# Altium project ESP32-S31-CoreBoard-1.PrjPcb
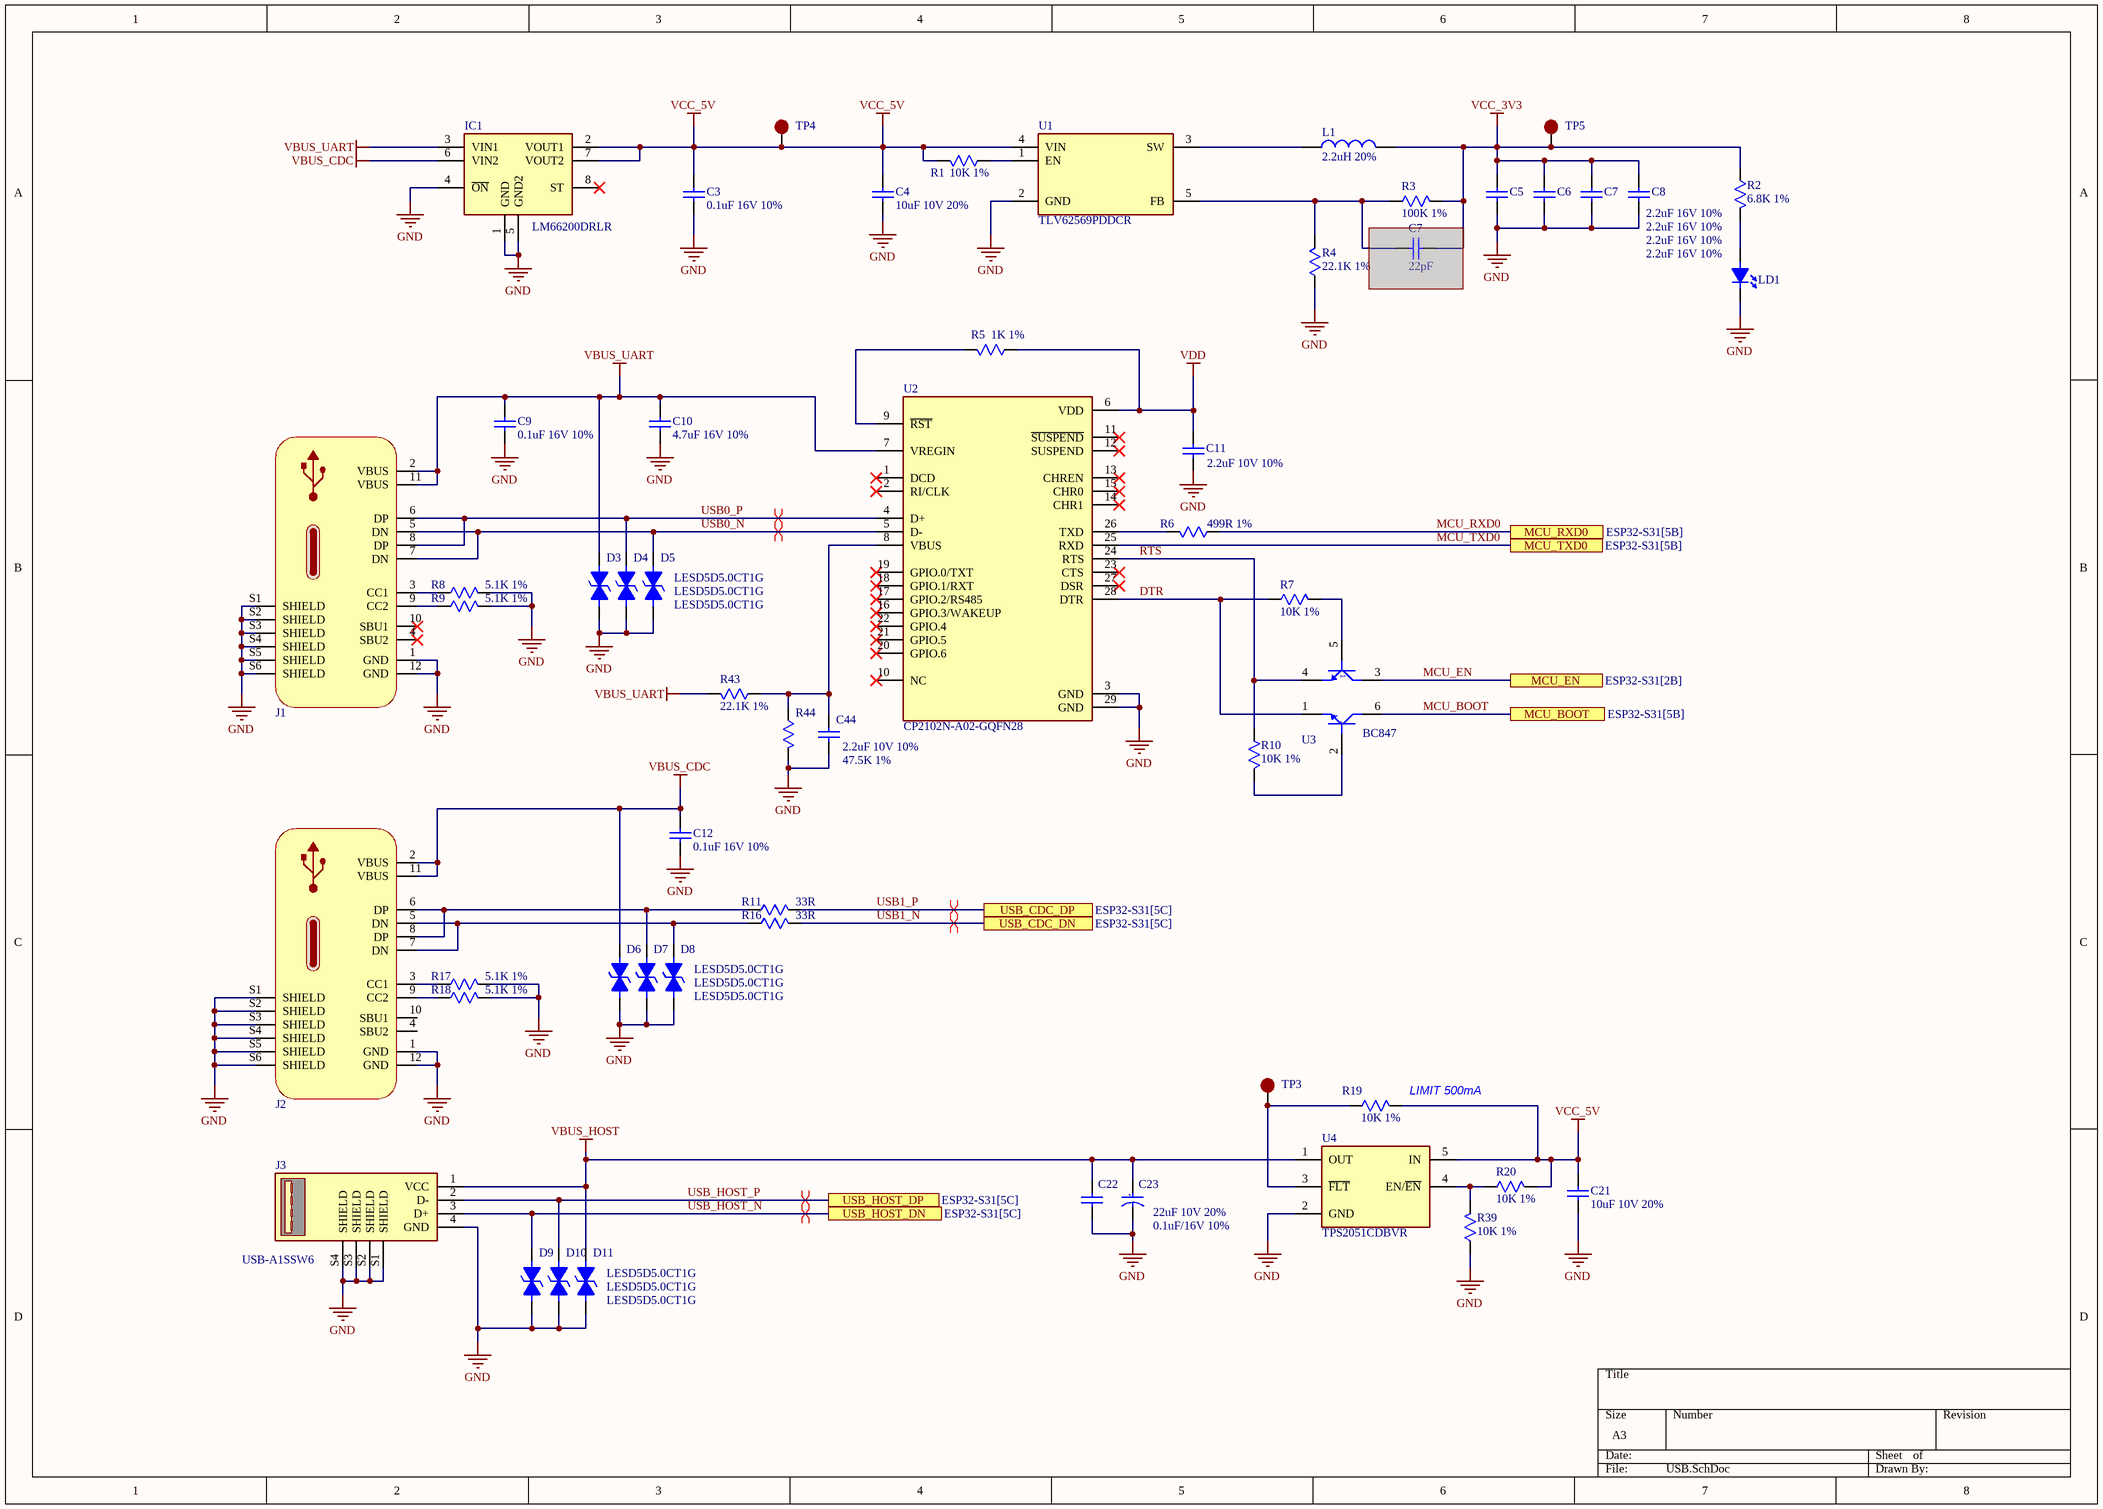
[diagram p0: USB.SchDoc]
4 sheets, 158 parts. Net scope: flat (ports and power ports of the same name join across sheets).
Board file: ESP32-S31-CoreBoard-1.PcbDoc
Sheets:
  USB.SchDoc
  ESP32-S31.SchDoc
  Audio.SchDoc
  Ethernet.SchDoc

## Sheet USB.SchDoc
size A3; SheetNumber: 1; SheetTotal: 4

### Parts
(Parts that share a designator on the sheet are numbered #1, #2 ... from top to bottom, then left to right.)
C3  0.1uF 16V 10%  [C0402]
C4  10uF 10V 20%  [C0805]
C5  2.2uF 16V 10%  [C0603]
C6  2.2uF 16V 10%  [C0603]
C7#1  2.2uF 16V 10%  [C0603]
C7#2  22pF  [C0402]  (masked out: inside a compile mask, not in the netlist)
C8  2.2uF 16V 10%  [C0603]
C9  0.1uF 16V 10%  [C0402]
C10  4.7uF 16V 10%  [C0603]
C11  2.2uF 10V 10%  [C0402]
C12  0.1uF 16V 10%  [C0603]
C21  10uF 10V 20%  [C0603]
C22  0.1uF/16V 10%  [C0402]
C23  22uF 10V 20%  [C1206P]
C44  2.2uF 10V 10%  [C0402]
D3  LESD5D5.0CT1G  [SOD-523]
D4  LESD5D5.0CT1G  [SOD-523]
D5  LESD5D5.0CT1G  [SOD-523]
D6  LESD5D5.0CT1G  [SOD-523]
D7  LESD5D5.0CT1G  [SOD-523]
D8  LESD5D5.0CT1G  [SOD-523]
D9  LESD5D5.0CT1G  [SOD-523]
D10  LESD5D5.0CT1G  [SOD-523]
D11  LESD5D5.0CT1G  [SOD-523]
IC1  LM66200DRLR  [SOT8]
J1  USB-C  [JAE_DX07S016JA1R1500]  (value not drawn)
J2  USB-C  [JAE_DX07S016JA1R1500]  (value not drawn)
J3  USB-A1SSW6  [USB-A-Vertical]
L1  2.2uH 20%  [IND_ASPI-0530HI-2R2M-T2]
LD1  LED-SMD  [LED0603]  (value not drawn)
R1  10K 1%  [R0402]
R2  6.8K 1%  [R0402]
R3  100K 1%  [R0402]
R4  22.1K 1%  [R0402]
R5  1K 1%  [R0402]
R6  499R 1%  [R0402]
R7  10K 1%  [R0402]
R8  5.1K 1%  [R0402]
R9  5.1K 1%  [R0402]
R10  10K 1%  [R0402]
R11  33R  [R0402]
R16  33R  [R0402]
R17  5.1K 1%  [R0402]
R18  5.1K 1%  [R0402]
R19  10K 1%  [R0402]
R20  10K 1%  [R0402]
R39#1  10K 1%  [R0402]
R43#1  22.1K 1%  [R0402]
R44#1  47.5K 1%  [R0402]
TP3  Test point  [TP]  (value not drawn)
TP4  Test point  [TP]  (value not drawn)
TP5  Test point  [TP]  (value not drawn)
U1  TLV62569PDDCR  [SOT23-5]
U2  CP2102N-A02-GQFN28  [QFN-28]
U3  BC847  [SOT-363]
U4  TPS2051CDBVR  [SOT23-5]

### Ports
MCU_BOOT (see ESP32-S31[5B]), MCU_EN (see ESP32-S31[2B]), MCU_RXD0 (see ESP32-S31[5B]), MCU_TXD0 (see ESP32-S31[5B]), USB_CDC_DN (see ESP32-S31[5C]), USB_CDC_DP (see ESP32-S31[5C]), USB_HOST_DN (see ESP32-S31[5C]), USB_HOST_DP (see ESP32-S31[5C])

### Nets
GND: C3.1 C4.1 C5.2 C6.2 C7#1.2 C8.2 C9.1 C10.1 C11.1 C12.1 C21.1 C22.1 C23.2 C44.1 D3.2(K) D4.2(K) D5.2(K) D6.2(K) D7.2(K) D8.2(K) D9.2(K) D10.2(K) D11.2(K) IC1.1(GND) IC1.4(~{ON}) IC1.5(GND2) J1.1(GND) J1.12(GND) J1.S1(SHIELD) J1.S2(SHIELD) J1.S3(SHIELD) J1.S4(SHIELD) J1.S5(SHIELD) J1.S6(SHIELD) J2.1(GND) J2.12(GND) J2.S1(SHIELD) J2.S2(SHIELD) J2.S3(SHIELD) J2.S4(SHIELD) J2.S5(SHIELD) J2.S6(SHIELD) J3.4(GND) J3.S1(SHIELD) J3.S2(SHIELD) J3.S3(SHIELD) J3.S4(SHIELD) LD1.2 R4.1 R8.2 R9.2 R17.2 R18.2 R39#1.1 R44#1.2 U1.2(GND) U2.3(GND) U2.29(GND) U4.2(GND)
VBUS_CDC: C12.2 D6.1(A) IC1.6(VIN2) J2.2(VBUS) J2.11(VBUS)
VBUS_HOST: C22.2 C23.1 D11.1(A) J3.1(VCC) U4.1(OUT)
VBUS_UART: C9.2 C10.2 D3.1(A) IC1.3(VIN1) J1.2(VBUS) J1.11(VBUS) R43#1.2 U2.7(VREGIN)
VCC_3V3: C5.1 C6.1 C7#1.1 C8.1 L1.2 R2.1 R3.2 TP5.1(EPAD)
VCC_5V: C3.2 C4.2 C21.2 IC1.2(VOUT1) IC1.7(VOUT2) R1.2 R19.2 R20.2 TP4.1(EPAD) U1.4(VIN) U4.5(IN)
VDD: C11.2 R5.1 U2.6(VDD)
DTR: R7.1 U2.28(DTR) U3.1
MCU_BOOT: U3.6 ; port MCU_BOOT
MCU_EN: U3.3 ; port MCU_EN
MCU_RXD0: R6.1 ; port MCU_RXD0
MCU_TXD0: U2.25(RXD) ; port MCU_TXD0
RTS: R10.1 U2.24(RTS) U3.4
USB0_N: D5.1(A) J1.5(DN) J1.7(DN) U2.5(D-)
USB0_P: D4.1(A) J1.6(DP) J1.8(DP) U2.4(D+)
USB1_N: R16.2 ; port USB_CDC_DN
USB1_P: R11.2 ; port USB_CDC_DP
USB_HOST_N: D9.1(A) J3.3(D+) ; port USB_HOST_DN
USB_HOST_P: D10.1(A) J3.2(D-) ; port USB_HOST_DP
NetC44_2: C44.2 R43#1.1 R44#1.1 U2.8(VBUS)
NetD7_1: D7.1(A) J2.6(DP) J2.8(DP) R11.1
NetD8_1: D8.1(A) J2.5(DN) J2.7(DN) R16.1
NetJ1_3: J1.3(CC1) R8.1
NetJ1_9: J1.9(CC2) R9.1
NetJ2_3: J2.3(CC1) R17.1
NetJ2_9: J2.9(CC2) R18.1
NetL1_1: L1.1 U1.3(SW)
NetLD1_1: LD1.1 R2.2
NetR1_1: R1.1 U1.1(EN)
NetR3_1: R3.1 R4.2 U1.5(FB)
NetR5_2: R5.2 U2.9(~{RST})
NetR6_2: R6.2 U2.26(TXD)
NetR7_2: R7.2 U3.5
NetR10_2: R10.2 U3.2
NetR19_1: R19.1 TP3.1(EPAD) U4.3(~{FLT})
NetR20_1: R20.1 R39#1.2 U4.4(EN/~{EN})

Not connected (* = marked no-connect by the designer): IC1 8(ST)*; J1 4(SBU2)* 10(SBU1)*; J2 4(SBU2) 10(SBU1); U2 1(DCD)* 2(RI/CLK)* 10(NC)* 11(~{SUSPEND})* 12(SUSPEND)* 13(CHREN)* 14(CHR1)* 15(CHR0)* 16(GPIO.3/WAKEUP)* 17(GPIO.2/RS485)* 18(GPIO.1/RXT)* 19(GPIO.0/TXT)* 20(GPIO.6)* 21(GPIO.5)* 22(GPIO.4)* 23(CTS)* 27(DSR)*

### Layout directives
differential pair: USB0_N, USB0_P, USB1_N, USB1_P, USB_HOST_N, USB_HOST_P

### Notes on the sheet
- (near R19) LIMIT 500mA
- (in symbol Capacitor_Tantalum) +

### Library data of the parts
C3-C6 C7#1 C7#2 C8-C12 C21 C22 C44 = Capacitor_Ceramic
C23 = Capacitor_Tantalum: MF: KYOCERA AVX; MP: TAJA106K016RNJ; SnapEDA_Link: https://www.snapeda.com/parts/TAJA106K016RNJ/Kyocera/view-part/?ref=snap; Package: Package; Value: *; Check_prices: https://www.snapeda.com/parts/TAJA106K016RNJ/Kyocera/view-part/?ref=eda
D3-D11 = Diode_ESD
IC1 = LM66200DRLR: 1.6-V to 5.5-V, 40-mâ„¦, 2.5-A, low-IQ, dual ideal diode; MF: Texas Instruments; SnapEDA_Link: https://www.snapeda.com/parts/LM66200DRLR/Texas+Instruments/view-part/?ref=snap; Package: None; Value: *; MP: LM66200DRLR; Check_prices: https://www.snapeda.com/parts/LM66200DRLR/Texas+Instruments/view-part/?ref=eda
J1 J2 = USB-C: USB-C (USB TYPE-C) USB 2.0 Receptacle Connector 24 (16+8 Dummy) Position Surface Mount, Right Angle; Through Hole; MP: DX07S016JA1R1500; Package: None; Value: *; Price: None; Availability: Unavailable
J3 = USB-A1SSW6: USB-A (USB TYPE-A) - Receptacle Connector 4 Position Through Hole, Right Angle; MF: On Shore; Value: *; SnapEDA_Link: https://www.snapeda.com/parts/USB-A1SSW6/On+Shore+Technology+Inc./view-part/?ref=snap; Purchase-URL: https://pricing.snapeda.com/search/part/USB-A1SSW6/?ref=eda; Availability: In Stock; Price: None; Package: None; Check_prices: https://www.snapeda.com/parts/USB-A1SSW6/On+Shore+Technology+Inc./view-part/?ref=eda; MP: USB-A1SSW6
L1 = Inductor
R1-R11 R16-R20 R39#1 R43#1 R44#1 = Resistor
U1 = TLV62569PDDCR: 2.5V-5.5V input, 2-A high efficiency step-down buck converter in SOT23 and SOT563 package; MF: Texas Instruments; SnapEDA_Link: https://www.snapeda.com/parts/TLV62569PDDCR/Texas+Instruments/view-part/?ref=snap; Package: SOT-23-THN-6 Texas Instruments; Value: *; MP: TLV62569PDDCR; Check_prices: https://www.snapeda.com/parts/TLV62569PDDCR/Texas+Instruments/view-part/?ref=eda
U2 = CP2102N-A02-GQFN28: USB TO UART BRIDGE, -40 TO 85DEG C; Bridge Type:USB to UART; Supply Voltage Min:3V; Supply Voltage Max:3.6V; Interface Case Style:QFN; No. of Pins:28Pins; Operating Temperature Min:-40Â°C; Operating Temperature Max:85Â°C; Product Range:-; Automotive Quali; MF: Silicon Labs; MP: CP2102NA02GQFN28; SnapEDA_Link: https://www.snapeda.com/parts/CP2102NA02GQFN28/Silicon+Labs/view-part/?ref=snap; Package: None; Value: *; Check_prices: https://www.snapeda.com/parts/CP2102NA02GQFN28/Silicon+Labs/view-part/?ref=eda
U3 = BC847: Bipolar (BJT) Transistor Array 2 NPN (Dual) 45V 100mA 100MHz 380mW Surface Mount SC-88/SC70-6/SOT-363; MF: onsemi; MP: BC847BDW1T1G; SnapEDA_Link: https://www.snapeda.com/parts/BC847BDW1T1G/Onsemi/view-part/?ref=snap; Package: SC-88-6 ON Semiconductor; Value: *; Check_prices: https://www.snapeda.com/parts/BC847BDW1T1G/Onsemi/view-part/?ref=eda
U4 = TPS2051CDBVR: 0.5A loading, 4.5-5.5V, 97mÎ© USB power switch, active-high, output discharge, reverse blocking; MF: Texas Instruments; SnapEDA_Link: https://www.snapeda.com/parts/TPS2051CDBVR/Texas+Instruments/view-part/?ref=snap; Package: SOT-23-5 Texas Instruments; Value: *; MP: TPS2051CDBVR; Check_prices: https://www.snapeda.com/parts/TPS2051CDBVR/Texas+Instruments/view-part/?ref=eda

## Sheet ESP32-S31.SchDoc
size A3; SheetNumber: 2; SheetTotal: 4
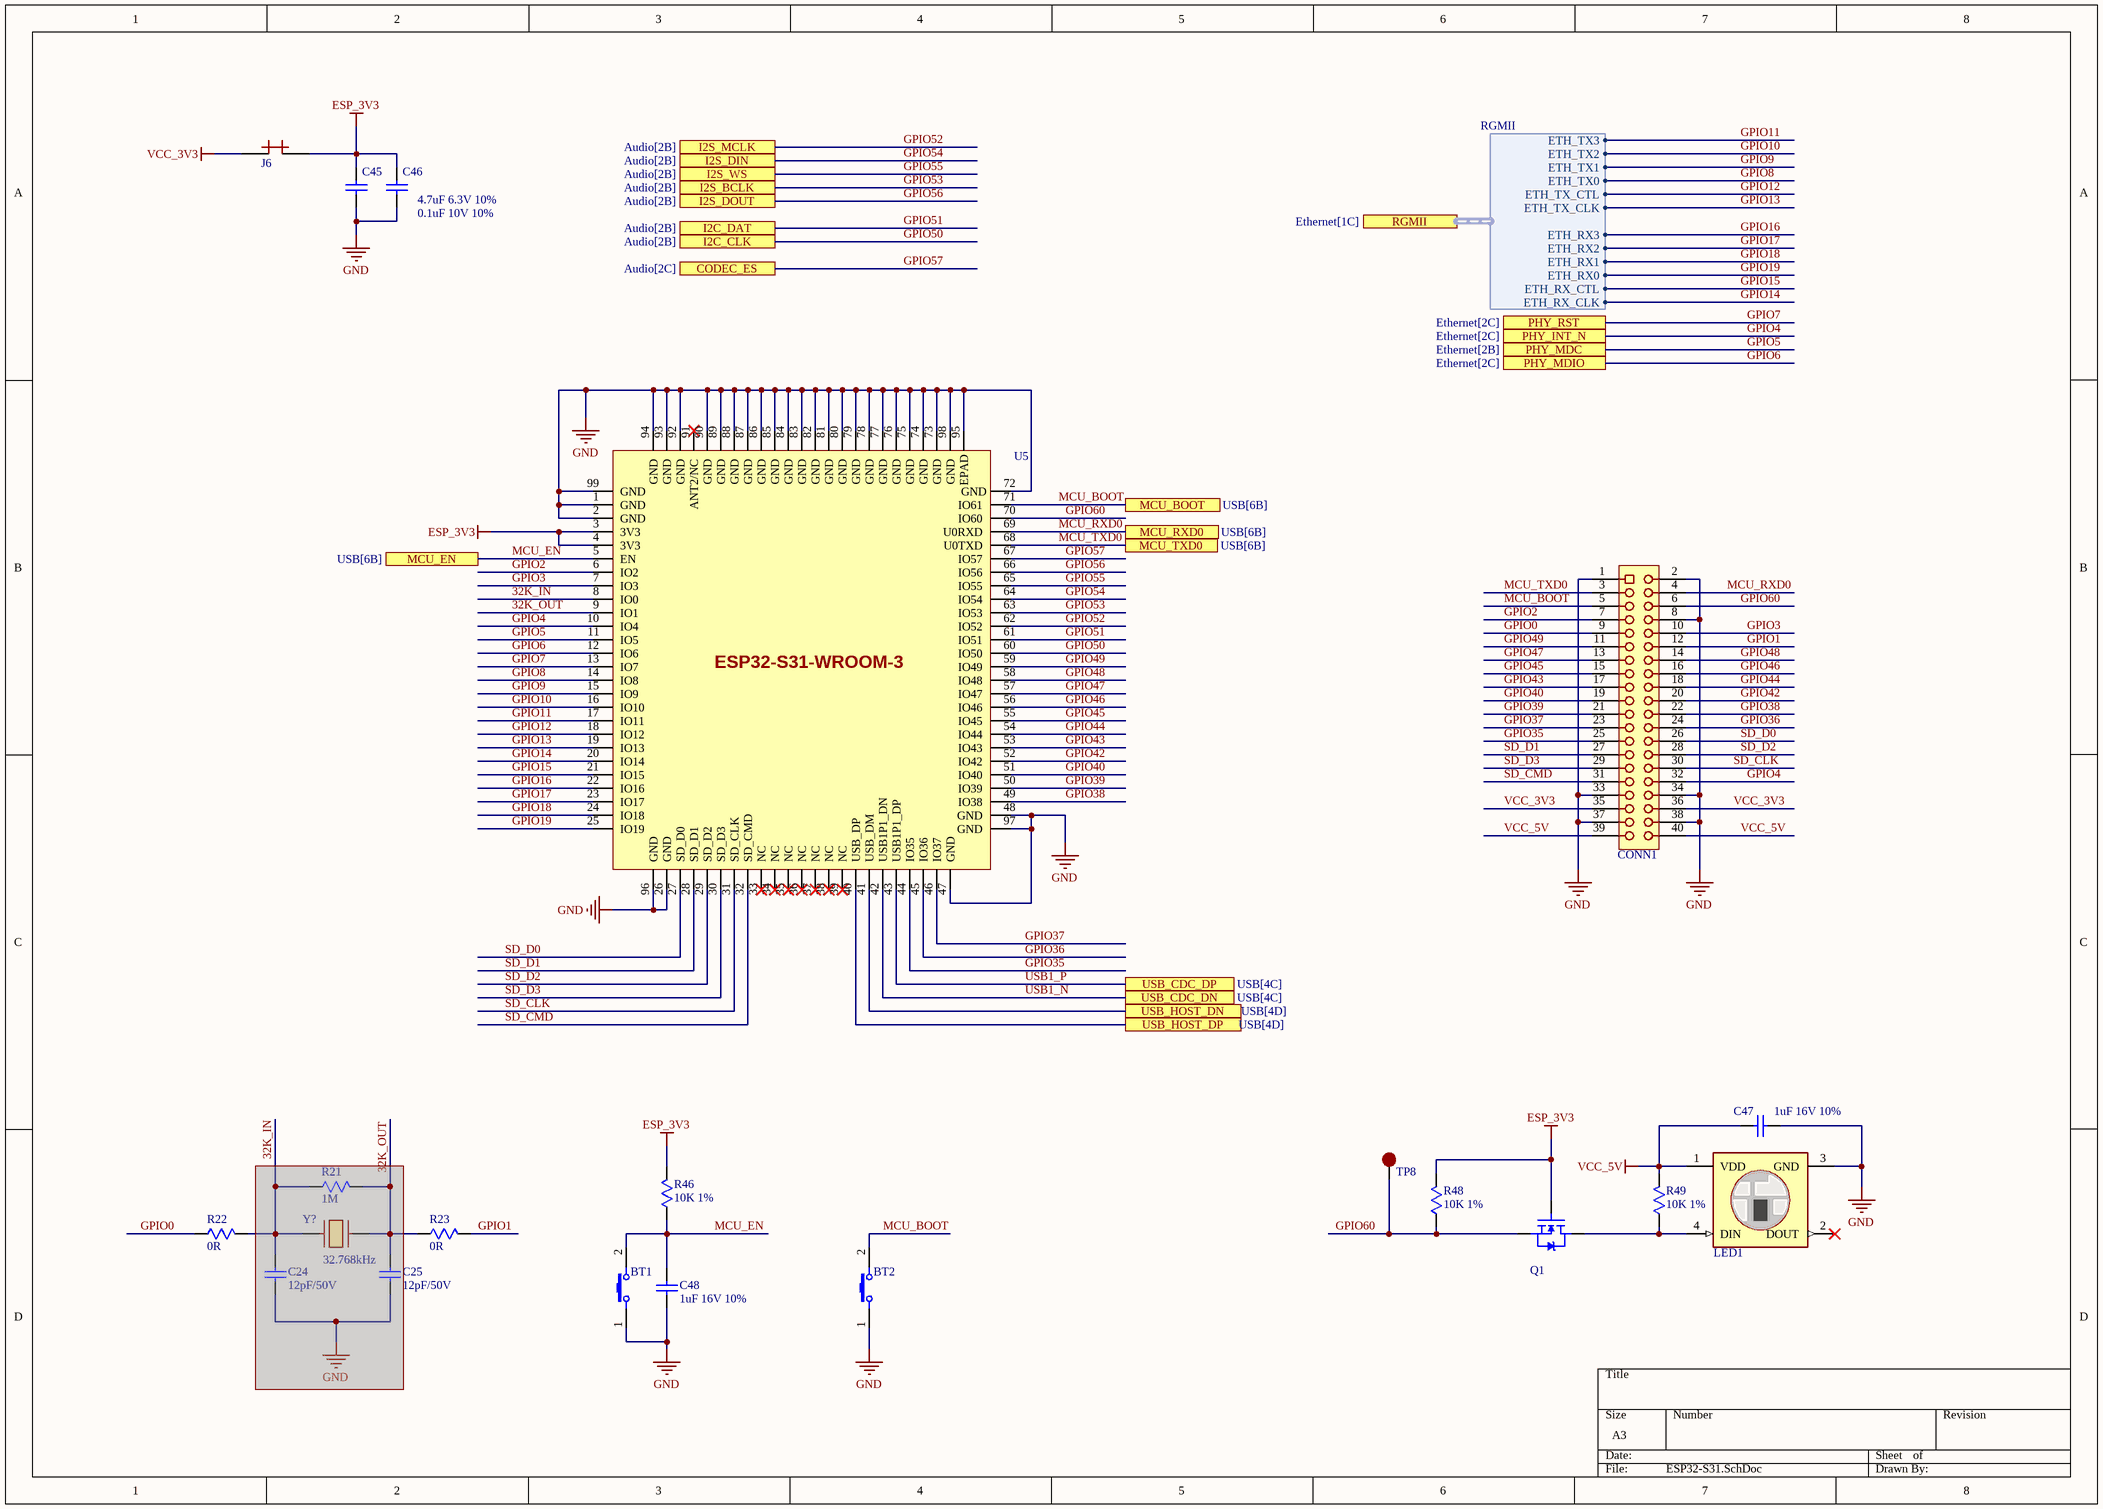
[diagram p1: ESP32-S31.SchDoc]

### Parts
(Parts that share a designator on the sheet are numbered #1, #2 ... from top to bottom, then left to right.)
BT1  Button-2  [SW_B3U-1000PM]  (value not drawn)
BT2  Button-2  [SW_B3U-1000PM]  (value not drawn)
C24#1  12pF/50V  [C0402]  (masked out: inside a compile mask, not in the netlist)
C25#1  12pF/50V  [C0402]  (masked out: inside a compile mask, not in the netlist)
C45  4.7uF 6.3V 10%  [C0603]
C46  0.1uF 10V 10%  [C0402]
C47  1uF 16V 10%  [C0603]
C48  1uF 16V 10%  [C0402]
CONN1  CONNECTOR-2X20  [2.54 2x20]  (value not drawn)
J6  Jump_2.54mm  [2.54 2X1]  (value not drawn)
LED1  ARGB  [WS2812-5050]  (value not drawn)
Q1  Mosfet N Signal  [SOT-23]  (value not drawn)
R21#1  1M  [R0402]  (masked out: inside a compile mask, not in the netlist)
R22  0R  [R0402]
R23  0R  [R0402]
R46#1  10K 1%  [R0402]
R48  10K 1%  [R0402]
R49  10K 1%  [R0402]
TP8  Test point  [TP]  (value not drawn)
U5  ESP32-S31-WROOM-3  [ESP32-S31-WROOM-3]  (value not drawn)
Y?  32.768kHz  [XTAL 2P 3215]  (masked out: inside a compile mask, not in the netlist)

### Ports
CODEC_ES (see Audio[2C]), I2C_CLK (see Audio[2B]), I2C_DAT (see Audio[2B]), I2S_BCLK (see Audio[2B]), I2S_DIN (see Audio[2B]), I2S_DOUT (see Audio[2B]), I2S_MCLK (see Audio[2B]), I2S_WS (see Audio[2B]), MCU_BOOT (see USB[6B]), MCU_EN (see USB[6B]), MCU_RXD0 (see USB[6B]), MCU_TXD0 (see USB[6B]), PHY_INT_N (see Ethernet[2C]), PHY_MDC (see Ethernet[2B]), PHY_MDIO (see Ethernet[2C]), PHY_RST (see Ethernet[2C]), RGMII (harness RGMII, see Ethernet[1C]), USB_CDC_DN (see USB[4C]), USB_CDC_DP (see USB[4C]), USB_HOST_DN (see USB[4D]), USB_HOST_DP (see USB[4D])

### Harnesses
RGMII: ETH_TX1, ETH_TX0, ETH_TX_CTL, ETH_TX_CLK, ETH_RX0, ETH_RX_CTL, ETH_RX_CLK, ETH_TX2, ETH_TX3, ETH_RX1, ETH_RX2, ETH_RX3

### Nets
ESP_3V3: C45.2 C46.2 J6.2 Q1.1(G) R46#1.1 R48.1 U5.3(3V3) U5.4(3V3)
GND: BT1.1 BT2.1 C45.1 C46.1 C47.1 C48.2 CONN1.1 CONN1.2 CONN1.8 CONN1.33 CONN1.34 CONN1.37 CONN1.38 LED1.3(GND) U5.1(GND) U5.2(GND) U5.26(GND) U5.47(GND) U5.48(GND) U5.72(GND) U5.73(GND) U5.74(GND) U5.75(GND) U5.76(GND) U5.77(GND) U5.78(GND) U5.79(GND) U5.80(GND) U5.81(GND) U5.82(GND) U5.83(GND) U5.84(GND) U5.85(GND) U5.86(GND) U5.87(GND) U5.88(GND) U5.89(GND) U5.90(GND) U5.92(GND) U5.93(GND) U5.94(GND) U5.95(EPAD) U5.96(GND) U5.97(GND) U5.98(GND) U5.99(GND)
VCC_3V3: CONN1.35 CONN1.36 J6.1
VCC_5V: C47.2 CONN1.39 CONN1.40 LED1.1(VDD) R49.1
32K_IN: U5.8(IO0)
32K_OUT: U5.9(IO1)
GPIO0: CONN1.9 R22.1
GPIO1: CONN1.12 R23.1
GPIO2: CONN1.7 U5.6(IO2)
GPIO3: CONN1.10 U5.7(IO3)
GPIO4: CONN1.32 U5.10(IO4) ; port PHY_INT_N
GPIO5: U5.11(IO5) ; port PHY_MDC
GPIO6: U5.12(IO6) ; port PHY_MDIO
GPIO7: U5.13(IO7) ; port PHY_RST
GPIO8: U5.14(IO8) ; port RGMII.ETH_TX0
GPIO9: U5.15(IO9) ; port RGMII.ETH_TX1
GPIO10: U5.16(IO10) ; port RGMII.ETH_TX2
GPIO11: U5.17(IO11) ; port RGMII.ETH_TX3
GPIO12: U5.18(IO12) ; port RGMII.ETH_TX_CTL
GPIO13: U5.19(IO13) ; port RGMII.ETH_TX_CLK
GPIO14: U5.20(IO14) ; port RGMII.ETH_RX_CLK
GPIO15: U5.21(IO15) ; port RGMII.ETH_RX_CTL
GPIO16: U5.22(IO16) ; port RGMII.ETH_RX3
GPIO17: U5.23(IO17) ; port RGMII.ETH_RX2
GPIO18: U5.24(IO18) ; port RGMII.ETH_RX1
GPIO19: U5.25(IO19) ; port RGMII.ETH_RX0
GPIO35: CONN1.25 U5.44(IO35)
GPIO36: CONN1.24 U5.45(IO36)
GPIO37: CONN1.23 U5.46(IO37)
GPIO38: CONN1.22 U5.49(IO38)
GPIO39: CONN1.21 U5.50(IO39)
GPIO40: CONN1.19 U5.51(IO40)
GPIO42: CONN1.20 U5.52(IO42)
GPIO43: CONN1.17 U5.53(IO43)
GPIO44: CONN1.18 U5.54(IO44)
GPIO45: CONN1.15 U5.55(IO45)
GPIO46: CONN1.16 U5.56(IO46)
GPIO47: CONN1.13 U5.57(IO47)
GPIO48: CONN1.14 U5.58(IO48)
GPIO49: CONN1.11 U5.59(IO49)
GPIO50: U5.60(IO50) ; port I2C_CLK
GPIO51: U5.61(IO51) ; port I2C_DAT
GPIO52: U5.62(IO52) ; port I2S_MCLK
GPIO53: U5.63(IO53) ; port I2S_BCLK
GPIO54: U5.64(IO54) ; port I2S_DIN
GPIO55: U5.65(IO55) ; port I2S_WS
GPIO56: U5.66(IO56) ; port I2S_DOUT
GPIO57: U5.67(IO57) ; port CODEC_ES
GPIO60: CONN1.6 Q1.2(D) R48.2 TP8.1(EPAD) U5.70(IO60)
MCU_BOOT: BT2.2 CONN1.5 U5.71(IO61) ; port MCU_BOOT
MCU_EN: BT1.2 C48.1 R46#1.2 U5.5(EN) ; port MCU_EN
MCU_RXD0: CONN1.4 U5.69(U0RXD) ; port MCU_RXD0
MCU_TXD0: CONN1.3 U5.68(U0TXD) ; port MCU_TXD0
SD_CLK: CONN1.30 U5.31(SD_CLK)
SD_CMD: CONN1.31 U5.32(SD_CMD)
SD_D0: CONN1.26 U5.27(SD_D0)
SD_D1: CONN1.27 U5.28(SD_D1)
SD_D2: CONN1.28 U5.29(SD_D2)
SD_D3: CONN1.29 U5.30(SD_D3)
USB1_N: U5.42(USB1P1_DN) ; port USB_CDC_DN
USB1_P: U5.43(USB1P1_DP) ; port USB_CDC_DP
USB_HOST_N: U5.41(USB_DM) ; port USB_HOST_DN
USB_HOST_P: U5.40(USB_DP) ; port USB_HOST_DP
NetLED1_4: LED1.4(DIN) Q1.3(S) R49.2

Not connected (* = marked no-connect by the designer): LED1 2(DOUT)*; R22 2; R23 2; U5 33(NC)* 34(NC)* 35(NC)* 36(NC)* 37(NC)* 38(NC)* 39(NC)* 91(ANT2/NC)*

### Library data of the parts
C24#1 C25#1 C45-C48 = Capacitor_Ceramic
LED1 = ARGB: 5050 symphony LED SMD; MF: Xinglight; MP: XL-5050RGBC-WS2812B; SnapEDA_Link: https://www.snapeda.com/parts/XL-5050RGBC-WS2812B/Xinglight/view-part/?ref=snap; Package: Package; Value: *; Check_prices: https://www.snapeda.com/parts/XL-5050RGBC-WS2812B/Xinglight/view-part/?ref=eda
Q1 = 2N7000
R21#1 R22 R23 R46#1 R48 R49 = Resistor
Y? = Crystal 2 Pin: LOW FREQUENCY CRYSTAL; MF: Micro Crystal; MP: CM7V-T1A-LOW-ESR-32.768KHZ-12.5PF-20-TA-QC; Package: SMD-2 Micro Crystal; Value: *; Check_prices: https://www.snapeda.com/parts/CM7V-T1A-LOW-ESR-32.768KHZ-12.5PF-20-TA-QC/Micro+Crystal/view-part/?ref=eda; SnapEDA_Link: https://www.snapeda.com/parts/CM7V-T1A-LOW-ESR-32.768KHZ-12.5PF-20-TA-QC/Micro+Crystal/view-part/?ref=snap; Availability: In Stock; Purchase-URL: https://pricing.snapeda.com/search/part/CM7V-T1A-LOW-ESR-32.768KHZ-12.5PF-20-TA-QC/?ref=eda; Price: None

## Sheet Audio.SchDoc
size A4; SheetNumber: 3; SheetTotal: 4
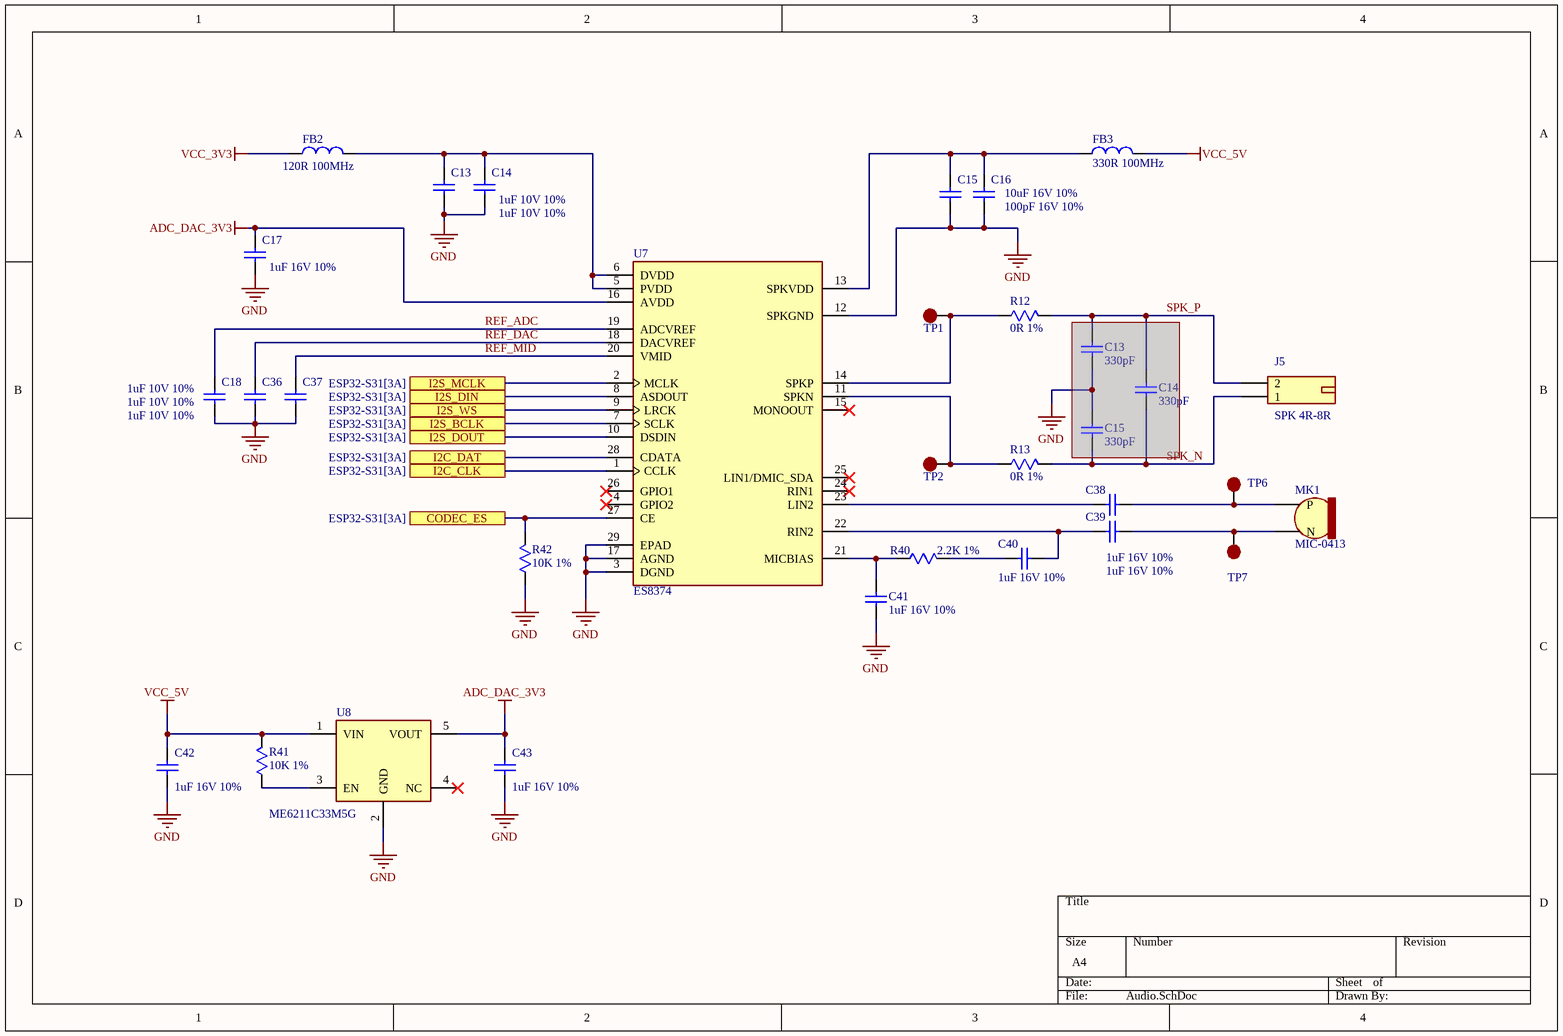
[diagram p2: Audio.SchDoc]

### Parts
(Parts that share a designator on the sheet are numbered #1, #2 ... from top to bottom, then left to right.)
C13#1  1uF 10V 10%  [C0402]
C13#2  330pF  [C0603]  (masked out: inside a compile mask, not in the netlist)
C14#1  1uF 10V 10%  [C0402]
C14#2  330pF  [C0603]  (masked out: inside a compile mask, not in the netlist)
C15#1  100pF 16V 10%  [C0402]
C15#2  330pF  [C0603]  (masked out: inside a compile mask, not in the netlist)
C16  10uF 16V 10%  [C0603]
C17  1uF 16V 10%  [C0402]
C18  1uF 10V 10%  [C0402]
C36  1uF 10V 10%  [C0402]
C37  1uF 10V 10%  [C0402]
C38  1uF 16V 10%  [C0402]
C39  1uF 16V 10%  [C0402]
C40  1uF 16V 10%  [C0402]
C41  1uF 16V 10%  [C0402]
C42  1uF 16V 10%  [C0402]
C43  1uF 16V 10%  [C0402]
FB2  120R 100MHz  [L0603]
FB3  330R 100MHz  [L0603]
J5  SPK 4R-8R  [JST_S2B-PH-SM4-TB(LF)(SN)]
MK1  MIC-0413  [MIC_CMEJ-0413-42-SMT-TR]
R12  0R 1%  [R0603]
R13  0R 1%  [R0603]
R40#1  2.2K 1%  [R0402]
R41#1  10K 1%  [R0402]
R42#1  10K 1%  [R0402]
TP1  Test point  [TP]  (value not drawn)
TP2  Test point  [TP]  (value not drawn)
TP6  Test point  [TP]  (value not drawn)
TP7  Test point  [TP]  (value not drawn)
U7  ES8374  [QFN-28]
U8  ME6211C33M5G  [SOT23-5]

### Ports
CODEC_ES (see ESP32-S31[3A]), I2C_CLK (see ESP32-S31[3A]), I2C_DAT (see ESP32-S31[3A]), I2S_BCLK (see ESP32-S31[3A]), I2S_DIN (see ESP32-S31[3A]), I2S_DOUT (see ESP32-S31[3A]), I2S_MCLK (see ESP32-S31[3A]), I2S_WS (see ESP32-S31[3A])

### Nets
ADC_DAC_3V3: C17.1 C43.1 U7.16(AVDD) U8.5(VOUT)
GND: C13#1.2 C14#1.2 C15#1.2 C16.2 C17.2 C18.2 C36.2 C37.2 C41.2 C42.2 C43.2 R42#1.1 U7.3(DGND) U7.12(SPKGND) U7.17(AGND) U7.29(EPAD) U8.2(GND)
VCC_3V3: FB2.1
VCC_5V: C42.1 FB3.1 R41#1.2 U8.1(VIN)
GPIO50: U7.1(CCLK) ; port I2C_CLK
GPIO51: U7.28(CDATA) ; port I2C_DAT
GPIO52: U7.2(MCLK) ; port I2S_MCLK
GPIO53: U7.7(SCLK) ; port I2S_BCLK
GPIO54: U7.8(ASDOUT) ; port I2S_DIN
GPIO55: U7.9(LRCK) ; port I2S_WS
GPIO56: U7.10(DSDIN) ; port I2S_DOUT
GPIO57: R42#1.2 U7.27(CE) ; port CODEC_ES
REF_ADC: C18.1 U7.19(ADCVREF)
REF_DAC: C36.1 U7.18(DACVREF)
REF_MID: C37.1 U7.20(VMID)
SPK_N: J5.1 R13.2
SPK_P: J5.2 R12.2
NetC13#1_1: C13#1.1 C14#1.1 FB2.2 U7.5(PVDD) U7.6(DVDD)
NetC15#1_1: C15#1.1 C16.1 FB3.2 U7.13(SPKVDD)
NetC38_1: C38.1 MK1.1(P) TP6.1(EPAD)
NetC38_2: C38.2 U7.23(LIN2)
NetC39_1: C39.1 MK1.2(N) TP7.1(EPAD)
NetC39_2: C39.2 C40.1 U7.22(RIN2)
NetC40_2: C40.2 R40#1.2
NetC41_1: C41.1 R40#1.1 U7.21(MICBIAS)
NetR12_1: R12.1 TP1.1(EPAD) U7.14(SPKP)
NetR13_1: R13.1 TP2.1(EPAD) U7.11(SPKN)
NetR41#1_1: R41#1.1 U8.3(EN)

Not connected (* = marked no-connect by the designer): U7 4(GPIO2)* 15(MONOOUT)* 24(RIN1)* 25(LIN1/DMIC_SDA)* 26(GPIO1)*; U8 4(NC)*

### Library data of the parts
C13#1 C13#2 C14#1 C14#2 C15#1 C15#2 C16-C18 C36-C43 = Capacitor_Ceramic
FB2 FB3 = Ferrite-bead
J5 = CONNECTOR-2P
MK1 = MIC-0413: 4.0 mm, Omnidirectional, Surface Mount, 2.0 Vdc, Electret Condenser Microphone; MF: Same Sky; MP: CMEJ-0413-42-SMT-TR; SnapEDA_Link: https://www.snapeda.com/parts/CMEJ-0413-42-SMT-TR/Same+Sky/view-part/?ref=snap; Package: CUI Inc.; Value: *; Check_prices: https://www.snapeda.com/parts/CMEJ-0413-42-SMT-TR/Same+Sky/view-part/?ref=eda
R12 R13 R40#1 R41#1 R42#1 = Resistor
U7 = ES8374: Low Power Mono Audio CODEC. 24-bit, 8 to 96 kHz sampling frequency, 95 dB signal to noise ratio.; MF: Everest Semiconductor; SnapEDA_Link: https://www.snapeda.com/parts/ES8374/Everest+Semiconductor/view-part/?ref=snap; Package: None; Value: *; MP: ES8374; Check_prices: https://www.snapeda.com/parts/ES8374/Everest+Semiconductor/view-part/?ref=eda
U8 = ME6211C33M5G: MF: Microne; SnapEDA_Link: https://www.snapeda.com/parts/ME6211C33M5G/Microne/view-part/?ref=snap; Package: None; Value: *; MP: ME6211C33M5G; Check_prices: https://www.snapeda.com/parts/ME6211C33M5G/Microne/view-part/?ref=eda

## Sheet Ethernet.SchDoc
size A3; SheetNumber: 4; SheetTotal: 4
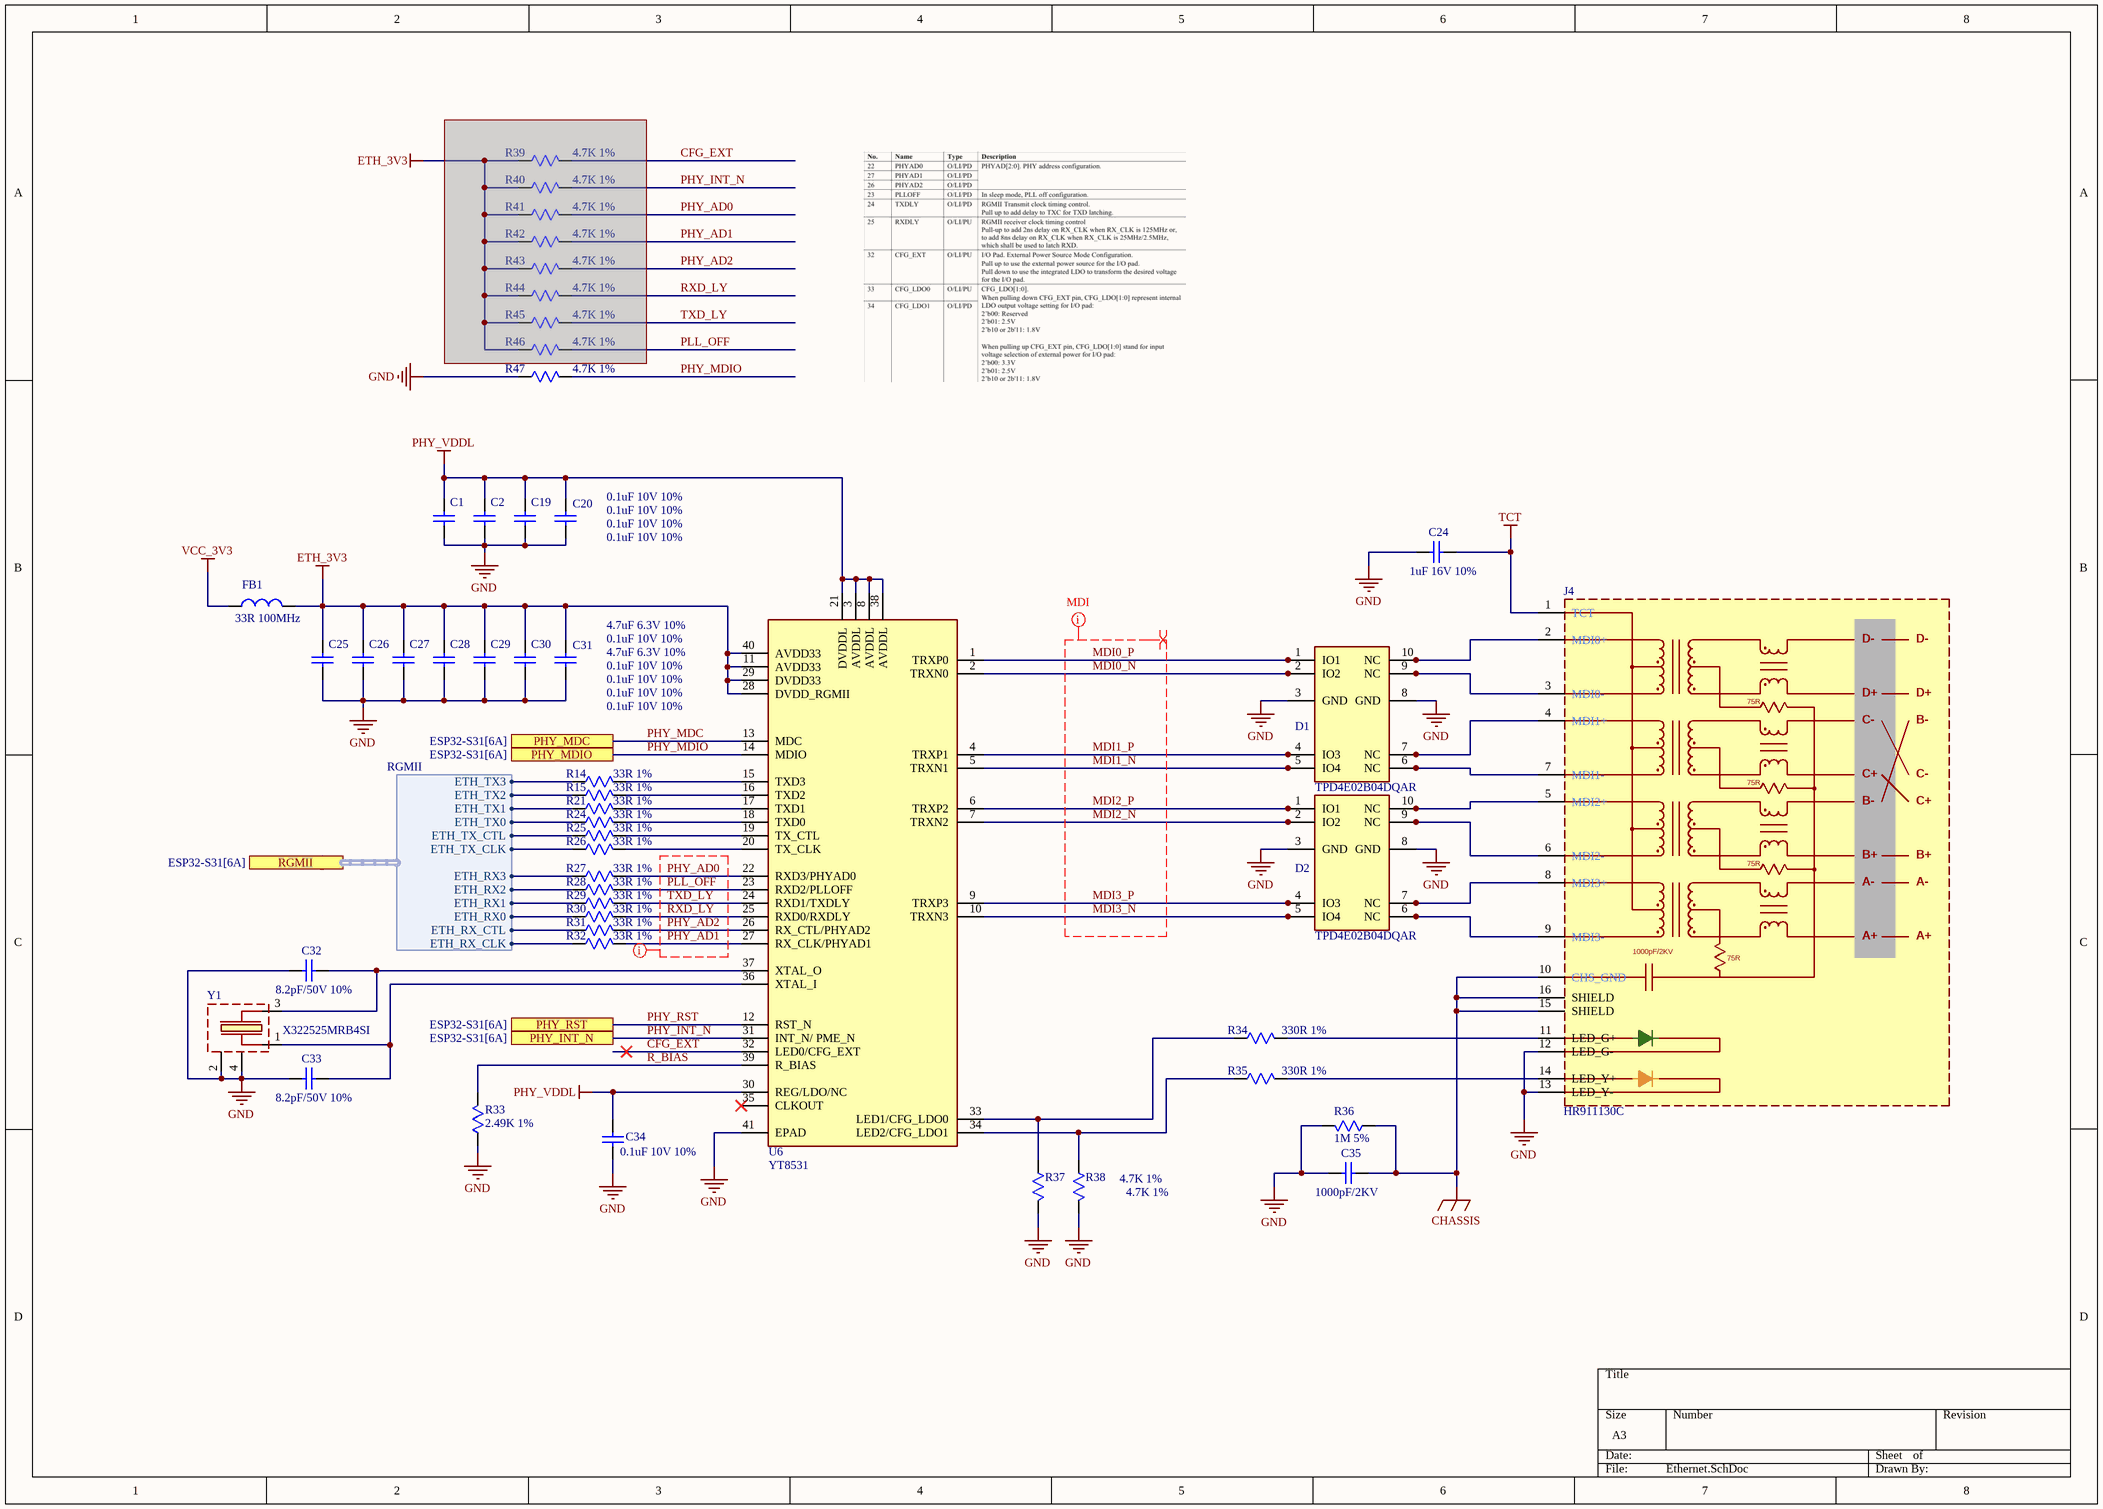
[diagram p3: Ethernet.SchDoc]

### Parts
(Parts that share a designator on the sheet are numbered #1, #2 ... from top to bottom, then left to right.)
C1  0.1uF 10V 10%  [C0402]
C2  0.1uF 10V 10%  [C0402]
C19  0.1uF 10V 10%  [C0402]
C20  0.1uF 10V 10%  [C0402]
C24#2  1uF 16V 10%  [C0603]
C25#2  4.7uF 6.3V 10%  [C0603]
C26  4.7uF 6.3V 10%  [C0603]
C27  0.1uF 10V 10%  [C0402]
C28  0.1uF 10V 10%  [C0402]
C29  0.1uF 10V 10%  [C0402]
C30  0.1uF 10V 10%  [C0402]
C31  0.1uF 10V 10%  [C0402]
C32  8.2pF/50V 10%  [C0402]
C33  8.2pF/50V 10%  [C0402]
C34  0.1uF 10V 10%  [C0402]
C35  1000pF/2KV  [C1206]
D1  TPD4E02B04DQAR  [USON-10]
D2  TPD4E02B04DQAR  [USON-10]
FB1  33R 100MHz  [L0603]
J4  HR911130C  [HR911130C]
R14  33R 1%  [R0402]
R15  33R 1%  [R0402]
R21#2  33R 1%  [R0402]
R24  33R 1%  [R0402]
R25  33R 1%  [R0402]
R26  33R 1%  [R0402]
R27  33R 1%  [R0402]
R28  33R 1%  [R0402]
R29  33R 1%  [R0402]
R30  33R 1%  [R0402]
R31  33R 1%  [R0402]
R32  33R 1%  [R0402]
R33  2.49K 1%  [R0402]
R34  330R 1%  [R0402]
R35  330R 1%  [R0402]
R36  1M 5%  [R1206]
R37  4.7K 1%  [R0402]
R38  4.7K 1%  [R0402]
R39#2  4.7K 1%  [R0402]  (masked out: inside a compile mask, not in the netlist)
R40#2  4.7K 1%  [R0402]  (masked out: inside a compile mask, not in the netlist)
R41#2  4.7K 1%  [R0402]  (masked out: inside a compile mask, not in the netlist)
R42#2  4.7K 1%  [R0402]  (masked out: inside a compile mask, not in the netlist)
R43#2  4.7K 1%  [R0402]  (masked out: inside a compile mask, not in the netlist)
R44#2  4.7K 1%  [R0402]  (masked out: inside a compile mask, not in the netlist)
R45  4.7K 1%  [R0402]  (masked out: inside a compile mask, not in the netlist)
R46#2  4.7K 1%  [R0402]  (masked out: inside a compile mask, not in the netlist)
R47  4.7K 1%  [R0402]
U6  YT8531  [QFN-40]
Y1  X322525MRB4SI  [XTAL 4P 3225]

### Ports
PHY_INT_N (see ESP32-S31[6A]), PHY_MDC (see ESP32-S31[6A]), PHY_MDIO (see ESP32-S31[6A]), PHY_RST (see ESP32-S31[6A]), RGMII (harness RGMII, see ESP32-S31[6A])

### Harnesses
RGMII: ETH_TX1, ETH_TX0, ETH_TX_CTL, ETH_TX_CLK, ETH_RX0, ETH_RX_CTL, ETH_RX_CLK, ETH_TX2, ETH_TX3, ETH_RX1, ETH_RX2, ETH_RX3

### Nets
CHASSIS: C35.2 J4.10(CHS_GND) J4.15(SHIELD) J4.16(SHIELD) R36.1
ETH_3V3: C25#2.2 C26.2 C27.2 C28.2 C29.2 C30.2 C31.2 FB1.2 U6.11(AVDD33) U6.28(DVDD_RGMII) U6.29(DVDD33) U6.40(AVDD33)
GND: C1.1 C2.1 C19.1 C20.1 C24#2.2 C25#2.1 C26.1 C27.1 C28.1 C29.1 C30.1 C31.1 C32.1 C33.1 C34.1 C35.1 D1.3(GND) D1.8(GND) D2.3(GND) D2.8(GND) J4.12(LED_G-) J4.13(LED_Y-) R33.1 R36.2 R37.2 R38.2 R47.1 U6.41(EPAD) Y1.2(GND) Y1.4(GND)
PHY_VDDL: C1.2 C2.2 C19.2 C20.2 C34.2 U6.3(AVDDL) U6.8(AVDDL) U6.21(DVDDL) U6.30(REG/LDO/NC) U6.38(AVDDL)
TCT: C24#2.1 J4.1(TCT)
VCC_3V3: FB1.1
CFG_EXT: U6.32(LED0/CFG_EXT)
GPIO8: R24.1 ; port RGMII.ETH_TX0
GPIO9: R21#2.1 ; port RGMII.ETH_TX1
GPIO10: R15.1 ; port RGMII.ETH_TX2
GPIO11: R14.1 ; port RGMII.ETH_TX3
GPIO12: R25.1 ; port RGMII.ETH_TX_CTL
GPIO13: R26.1 ; port RGMII.ETH_TX_CLK
GPIO14: R32.1 ; port RGMII.ETH_RX_CLK
GPIO15: R31.1 ; port RGMII.ETH_RX_CTL
GPIO16: R27.1 ; port RGMII.ETH_RX3
GPIO17: R28.1 ; port RGMII.ETH_RX2
GPIO18: R29.1 ; port RGMII.ETH_RX1
GPIO19: R30.1 ; port RGMII.ETH_RX0
MDI0_N: D1.2(IO2) D1.9(NC) J4.3(MDI0-) U6.2(TRXN0)
MDI0_P: D1.1(IO1) D1.10(NC) J4.2(MDI0+) U6.1(TRXP0)
MDI1_N: D1.5(IO4) D1.6(NC) J4.7(MDI1-) U6.5(TRXN1)
MDI1_P: D1.4(IO3) D1.7(NC) J4.4(MDI1+) U6.4(TRXP1)
MDI2_N: D2.2(IO2) D2.9(NC) J4.6(MDI2-) U6.7(TRXN2)
MDI2_P: D2.1(IO1) D2.10(NC) J4.5(MDI2+) U6.6(TRXP2)
MDI3_N: D2.5(IO4) D2.6(NC) J4.9(MDI3-) U6.10(TRXN3)
MDI3_P: D2.4(IO3) D2.7(NC) J4.8(MDI3+) U6.9(TRXP3)
PHY_AD0: R27.2 U6.22(RXD3/PHYAD0)
PHY_AD1: R32.2 U6.27(RX_CLK/PHYAD1)
PHY_AD2: R31.2 U6.26(RX_CTL/PHYAD2)
PHY_INT_N: U6.31(INT_N/_PME_N) ; port PHY_INT_N  [project net GPIO4]
PHY_MDC: U6.13(MDC) ; port PHY_MDC  [project net GPIO5]
PHY_MDIO: R47.2 U6.14(MDIO) ; port PHY_MDIO  [project net GPIO6]
PHY_RST: U6.12(RST_N) ; port PHY_RST  [project net GPIO7]
PLL_OFF: R28.2 U6.23(RXD2/PLLOFF)
R_BIAS: R33.2 U6.39(R_BIAS)
RXD_LY: R30.2 U6.25(RXD0/RXDLY)
TXD_LY: R29.2 U6.24(RXD1/TXDLY)
NetC32_2: C32.2 U6.37(XTAL_O) Y1.3
NetC33_2: C33.2 U6.36(XTAL_I) Y1.1
NetJ4_11: J4.11(LED_G+) R34.2
NetJ4_14: J4.14(LED_Y+) R35.2
NetR14_2: R14.2 U6.15(TXD3)
NetR15_2: R15.2 U6.16(TXD2)
NetR21#2_2: R21#2.2 U6.17(TXD1)
NetR24_2: R24.2 U6.18(TXD0)
NetR25_2: R25.2 U6.19(TX_CTL)
NetR26_2: R26.2 U6.20(TX_CLK)
NetR34_1: R34.1 R37.1 U6.33(LED1/CFG_LDO0)
NetR35_1: R35.1 R38.1 U6.34(LED2/CFG_LDO1)

Not connected (* = marked no-connect by the designer): U6 35(CLKOUT)*

### Layout directives
differential pair; differential pair class MDI_class: MDI0_N, MDI0_P, MDI1_N, MDI1_P, MDI2_N, MDI2_P, MDI3_N, MDI3_P
net class MDI: MDI0_N, MDI0_P, MDI1_N, MDI1_P, MDI2_N, MDI2_P, MDI3_N, MDI3_P
net class RGMII: (no net found under the mark), PHY_AD0, PHY_AD1, PHY_AD2, PLL_OFF, RXD_LY, TXD_LY

### Notes on the sheet
- (in symbol HR911130C) D-; D+; 75R; C-; B-; C+; B+; A-; A+; 1000pF/2KV

### Library data of the parts
C1 C2 C19 C20 C25#2 C26-C35 = Capacitor_Ceramic
C24#2 = Capacitor_Ceramic: C60474
D1 D2 = Diode ESD array: 4-channel ESD protection diode for USB Type-C and HDMI 2.0 10-USON -40 to 125; MF: Texas Instruments; Value: *; MP: TPD4E02B04DQAR; Package: USON-10 Texas Instruments; Purchase-URL: https://pricing.snapeda.com/search/part/TPD4E02B04DQAR/?ref=eda; SnapEDA_Link: https://www.snapeda.com/parts/TPD4E02B04DQAR/Texas%20Instruments/view-part/576424/?ref=snap; Check_prices: https://www.snapeda.com/parts/TPD4E02B04DQAR/Texas%20Instruments/view-part/576424/?ref=eda; Digi-Key_Part_Number: 296-43875-1-ND
FB1 = Ferrite-bead: BLM18PG330SN1D
J4 = HR911130C: SINGLE PORT RJ45 CONNECTOR WITH INTEGRATED MAGNETICS AND LED; Manufacturer_Name: Hanrun Electronics; Geometry.Height: 15mm; Manufacturer_Part_Number: HR911130C; Mouser Part Number: *; Mouser Price/Stock: *; Arrow Part Number: *; Arrow Price/Stock: *; Datasheet Link: http://www.cecb2b.com/batchupload/inventoryother/zfa_ic_inventory/2011121/zfa__204559_a7c3c0b2f5d8a53eec456bb4b34ade89.PDF
R14 R15 R21#2 R24-R38 R39#2 R40#2 R41#2 R42#2 R43#2 R44#2 R45 R46#2 R47 = Resistor
U6 = YT8531: INTEGRATED 10/100/1000 GIGABIT ETHERNET TRANSCEIVER; MF: Texas Instruments; MP: TLK1221RHATG4; SnapEDA_Link: https://www.snapeda.com/parts/TLK1221RHATG4/Texas+Instruments/view-part/?ref=snap; Package: VQFN-40 Texas Instruments; Value: *; Check_prices: https://www.snapeda.com/parts/TLK1221RHATG4/Texas+Instruments/view-part/?ref=eda
Y1 = Crystal 4 Pin: 25 MHz ±10ppm Crystal 18pF 40 Ohms 4-SMD, No Lead; MP: TSX-3225 25.0000MF10P-C0; MF: EPSON; Purchase-URL: https://pricing.snapeda.com/search/part/TSX-3225 25.0000MF10P-C0/?ref=eda; Package: SMD-4 EPSON; Value: *; Availability: In Stock; Price: None; SnapEDA_Link: https://www.snapeda.com/parts/TSX-3225%2025.0000MF10P-C0/EPSON/view-part/?ref=snap; Check_prices: https://www.snapeda.com/parts/TSX-3225%2025.0000MF10P-C0/EPSON/view-part/?ref=eda

## Nets that join several sheets
GND: USB (59 pins), ESP32-S31 (46 pins), Audio (17 pins), Ethernet (30 pins)
VCC_3V3: USB (8 pins), ESP32-S31 (CONN1.35 CONN1.36 J6.1), Audio (FB2.1), Ethernet (FB1.1)
VCC_5V: USB (11 pins), ESP32-S31 (5 pins), Audio (C42.1 FB3.1 R41#1.2 U8.1)
GPIO4: ESP32-S31 (CONN1.32 U5.10), Ethernet (U6.31)
GPIO5: ESP32-S31 (U5.11), Ethernet (U6.13)
GPIO6: ESP32-S31 (U5.12), Ethernet (R47.2 U6.14)
GPIO7: ESP32-S31 (U5.13), Ethernet (U6.12)
GPIO8: ESP32-S31 (U5.14), Ethernet (R24.1)
GPIO9: ESP32-S31 (U5.15), Ethernet (R21#2.1)
GPIO10: ESP32-S31 (U5.16), Ethernet (R15.1)
GPIO11: ESP32-S31 (U5.17), Ethernet (R14.1)
GPIO12: ESP32-S31 (U5.18), Ethernet (R25.1)
GPIO13: ESP32-S31 (U5.19), Ethernet (R26.1)
GPIO14: ESP32-S31 (U5.20), Ethernet (R32.1)
GPIO15: ESP32-S31 (U5.21), Ethernet (R31.1)
GPIO16: ESP32-S31 (U5.22), Ethernet (R27.1)
GPIO17: ESP32-S31 (U5.23), Ethernet (R28.1)
GPIO18: ESP32-S31 (U5.24), Ethernet (R29.1)
GPIO19: ESP32-S31 (U5.25), Ethernet (R30.1)
GPIO50: ESP32-S31 (U5.60), Audio (U7.1)
GPIO51: ESP32-S31 (U5.61), Audio (U7.28)
GPIO52: ESP32-S31 (U5.62), Audio (U7.2)
GPIO53: ESP32-S31 (U5.63), Audio (U7.7)
GPIO54: ESP32-S31 (U5.64), Audio (U7.8)
GPIO55: ESP32-S31 (U5.65), Audio (U7.9)
GPIO56: ESP32-S31 (U5.66), Audio (U7.10)
GPIO57: ESP32-S31 (U5.67), Audio (R42#1.2 U7.27)
MCU_BOOT: USB (U3.6), ESP32-S31 (BT2.2 CONN1.5 U5.71)
MCU_EN: USB (U3.3), ESP32-S31 (BT1.2 C48.1 R46#1.2 U5.5)
MCU_RXD0: USB (R6.1), ESP32-S31 (CONN1.4 U5.69)
MCU_TXD0: USB (U2.25), ESP32-S31 (CONN1.3 U5.68)
USB1_N: USB (R16.2), ESP32-S31 (U5.42)
USB1_P: USB (R11.2), ESP32-S31 (U5.43)
USB_HOST_N: USB (D9.1 J3.3), ESP32-S31 (U5.41)
USB_HOST_P: USB (D10.1 J3.2), ESP32-S31 (U5.40)